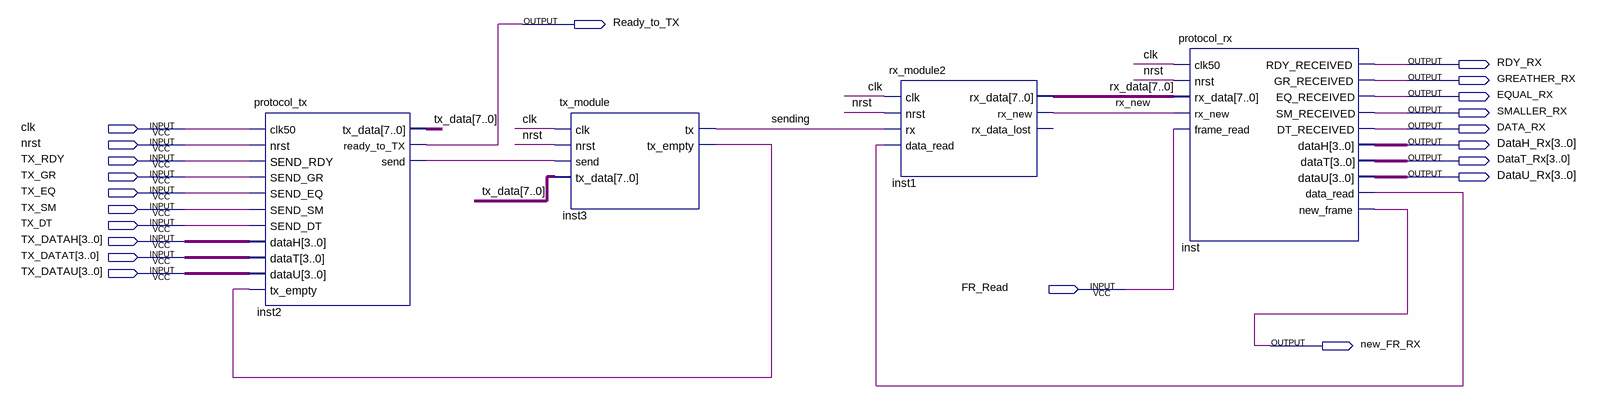
[diagram p0: schematic sheet]
// Quartus schematic Transmiter_Receiver.bdf as structural Verilog: 4 symbols, 21 pins
module Transmiter_Receiver (
  input  clk,
  input  nrst,
  input  TX_RDY,
  input  TX_GR,
  input  TX_EQ,
  input  TX_SM,
  input  TX_DT,
  input  [3:0] TX_DATAH,
  input  [3:0] TX_DATAT,
  input  [3:0] TX_DATAU,
  input  FR_Read,
  output Ready_to_TX,
  output RDY_RX,
  output GREATHER_RX,
  output EQUAL_RX,
  output SMALLER_RX,
  output DATA_RX,
  output [3:0] DataH_Rx,
  output [3:0] DataT_Rx,
  output [3:0] DataU_Rx,
  output new_FR_RX
);

  wire inst2_send, inst3_tx_empty, inst_data_read, rx_new, sending;
  wire [7:0] rx_data, tx_data;

  protocol_tx inst2 (
    .clk50(clk), .nrst(nrst), .SEND_RDY(TX_RDY), .SEND_GR(TX_GR), .SEND_EQ(TX_EQ), .SEND_SM(TX_SM),
    .SEND_DT(TX_DT), .dataH(TX_DATAH), .dataT(TX_DATAT), .dataU(TX_DATAU), .tx_empty(inst3_tx_empty),
    .tx_data(tx_data), .ready_to_TX(Ready_to_TX), .send(inst2_send));
  tx_module inst3 (
    .clk(clk), .nrst(nrst), .send(inst2_send), .tx_data(tx_data), .tx(sending), .tx_empty(inst3_tx_empty));
  rx_module2 inst1 (
    .clk(clk), .nrst(nrst), .rx(sending), .data_read(inst_data_read), .rx_data(rx_data), .rx_new(rx_new));  // open: rx_data_lost
  protocol_rx inst (
    .clk50(clk), .nrst(nrst), .rx_data(rx_data), .rx_new(rx_new), .frame_read(FR_Read),
    .RDY_RECEIVED(RDY_RX), .GR_RECEIVED(GREATHER_RX), .EQ_RECEIVED(EQUAL_RX), .SM_RECEIVED(SMALLER_RX),
    .DT_RECEIVED(DATA_RX), .dataH(DataH_Rx), .dataT(DataT_Rx), .dataU(DataU_Rx), .data_read(inst_data_read),
    .new_frame(new_FR_RX));
endmodule
